# EAGLE design Duress_Badge_V2.0 (EAGLE 9.6.2)
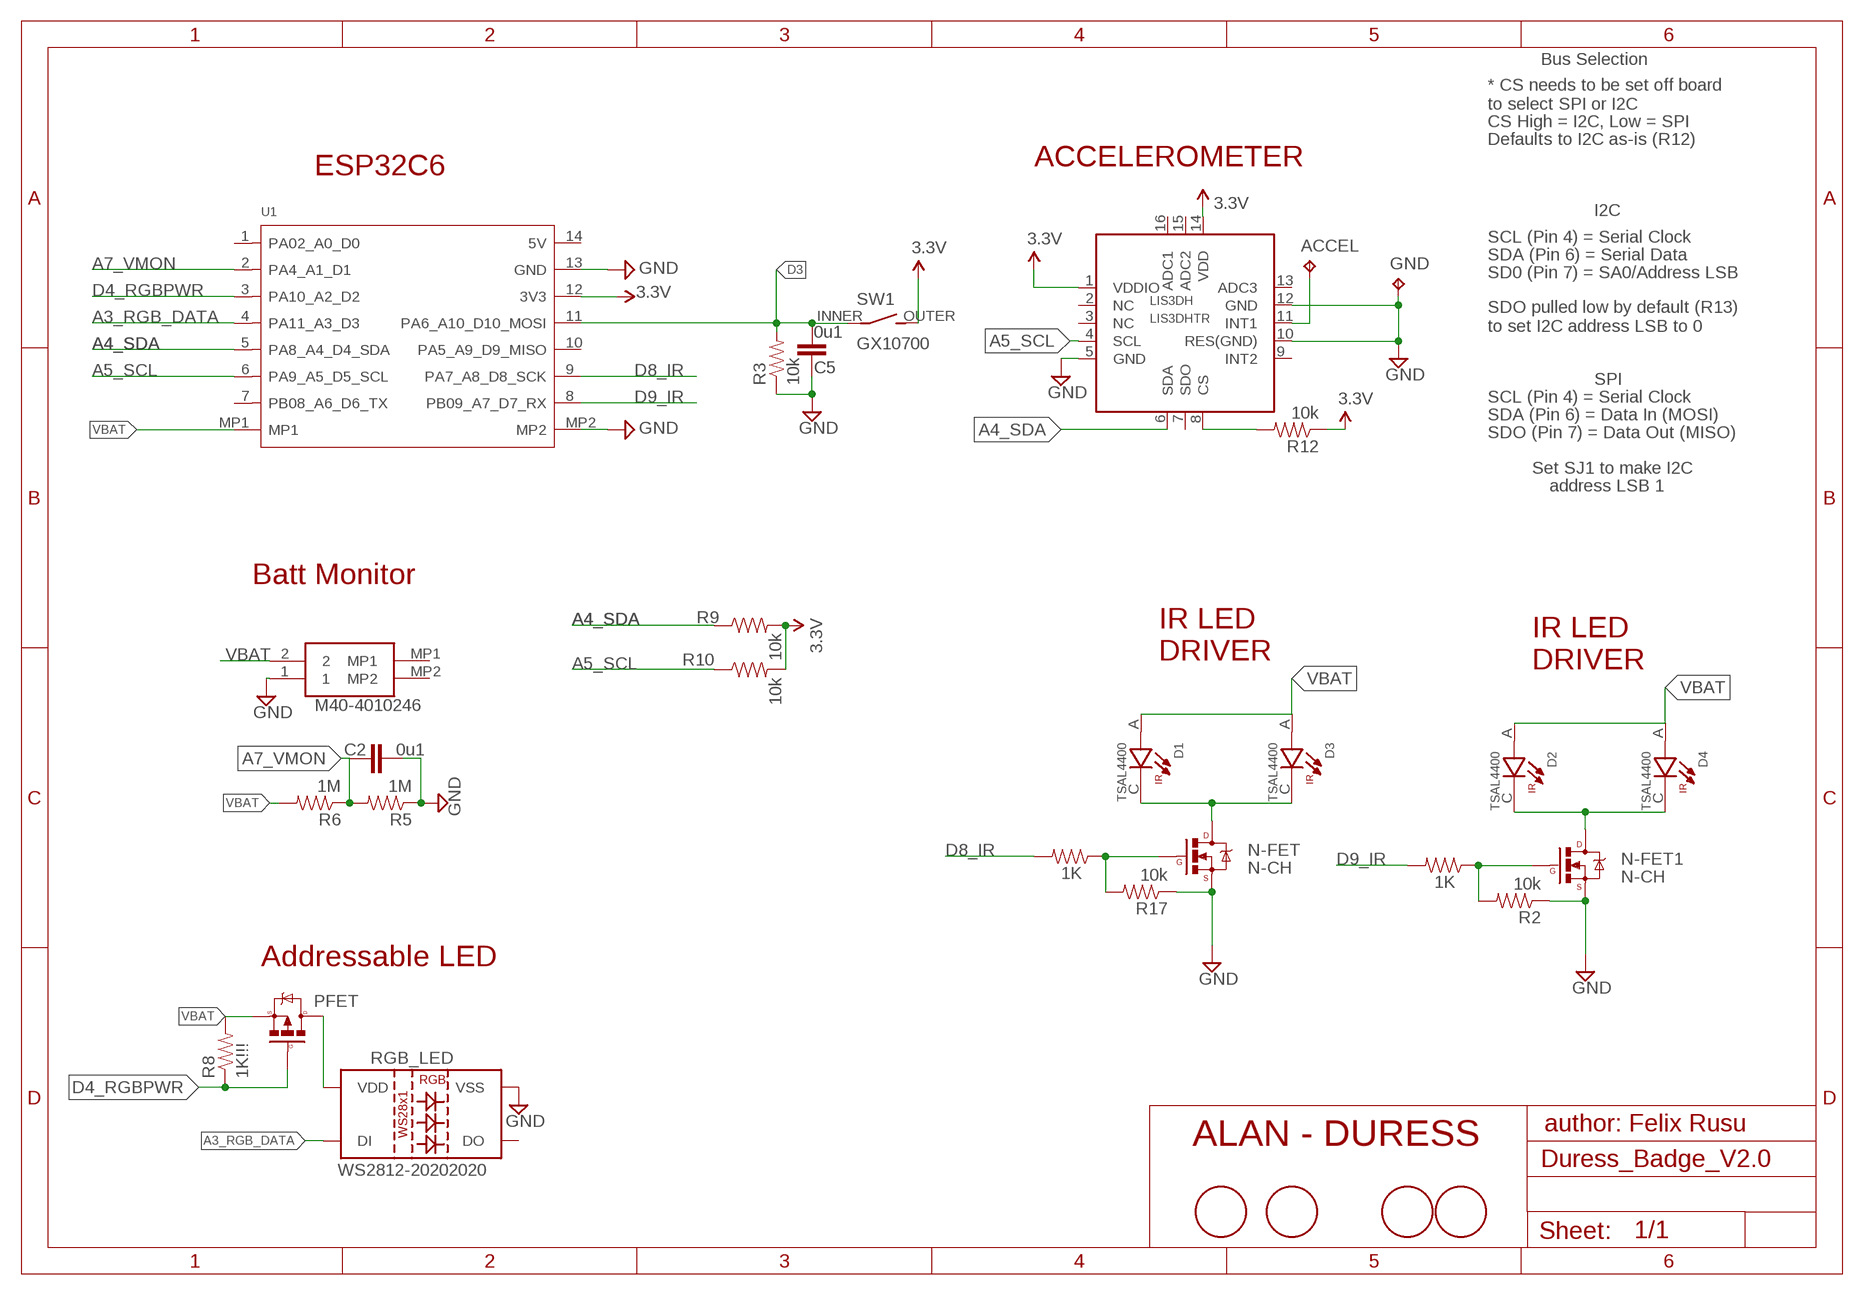
[diagram p0: schematic, sheet 1]

## Parts
ACCEL  TPB2,54  [B2,54]
BR_FIDUCIAL  FIDUCIAL1.5MM  [FIDUCIAL_1.5MM]
C2  0u1  CAP0603-CAP  [0603-CAP]
C5  0u1  CAP0603-CAP  [0603-CAP]
D1  TSAL4400  [LEDRD254W45D335H610]
D2  TSAL4400  [LEDRD254W45D335H610]
D3  TSAL4400  [LEDRD254W45D335H610]
D4  TSAL4400  [LEDRD254W45D335H610]
FIDUCIAL_BOTTOMRIGHT  FIDUCIALSQ  [FIDUCIAL_1.5MM_SQ]
FIDUCIAL_TOPLEFT  FIDUCIALSQ  [FIDUCIAL_1.5MM_SQ]
GND  TPB2,54  [B2,54]
JST1  M40-4010246  [M404010246]
LIS3DH  LIS3DHTR  ACCEL_LIS3DHTR  [LGA16_3X3MM]
N-FET  N-CH  MOSFET-NCHANNEL  [SOT23-3]
N-FET1  N-CH  MOSFET-NCHANNEL  [SOT23-3]
PFET  MOSFET-PCHANNELSMD  [SOT23-3]
R1  1K  RESISTOR0603-RES  [0603-RES]
R2  10k  RESISTOR0603-RES  [0603-RES]
R3  10k  RESISTOR0603-RES  [0603-RES]
R4  1K  RESISTOR0603-RES  [0603-RES]
R5  1M  RESISTOR0603-RES  [0603-RES]
R6  1M  RESISTOR0603-RES  [0603-RES]
R8  1K!!!  RESISTOR0603-RES  [0603-RES]
R9  10k  RESISTOR0603-RES  [0603-RES]
R10  10k  RESISTOR0603-RES  [0603-RES]
R12  10k  RESISTOR0603-RES  [0603-RES]
R17  10k  RESISTOR0603-RES  [0603-RES]
RGB_LED  WS2812-20202020  [WS2812-2020]
SW1  GX10700  [GX10700]
TL_FIDUCIAL  FIDUCIAL1.5MM  [FIDUCIAL_1.5MM]
U1  MOUDLE-SEEEDUINO-XIAO  [MOUDLE14P-2.54-21X17.8MM]

## Nets
A3_RGB_DATA: RGB_LED.3(DI) U1.4(PA11_A3_D3)
A4_SDA: LIS3DH.6(SDA) R9.1 U1.5(PA8_A4_D4_SDA)
A5_SCL: LIS3DH.4(SCL) R10.1 U1.6(PA9_A5_D5_SCL)
A7_VMON: C2.1 R5.2 R6.1 U1.2(PA4_A1_D1)
D3: C5.2 R3.2 SW1.INNER(P) U1.11(PA6_A10_D10_MOSI)
D4_RGBPWR: PFET.1(G) R8.1 U1.3(PA10_A2_D2)
D7_ACCEL: ACCEL.TP LIS3DH.11(INT1)
D8_IR: R4.2 U1.9(PA7_A8_D8_SCK)
D9_IR: R1.2 U1.8(PB09_A7_D7_RX)
GND: C2.2 C5.1 GND.TP JST1.1 LIS3DH.5(GND) LIS3DH.10(RES(GND)) LIS3DH.12(GND) N-FET1.2(S) N-FET.2(S) R2.1 R3.1 R5.1 R17.1 RGB_LED.2(VSS) U1.13(GND) U1.MP2
N$2: D1.C D3.C N-FET.3(D)
N$3: N-FET1.1(G) R1.1 R2.2
N$4: D2.C D4.C N-FET1.3(D)
N$5: PFET.3(D) RGB_LED.4(VDD)
N$6: N-FET.1(G) R4.1 R17.2
N$11: LIS3DH.8(CS) R12.2
VBAT: D1.A D2.A D3.A D4.A JST1.2 PFET.2(S) R6.2 R8.2 U1.MP1
VCC: LIS3DH.1(VDDIO) LIS3DH.14(VDD) R9.2 R10.2 R12.1 SW1.OUTER(S) U1.12(3V3) ; supply symbol labelled 3.3V
Unconnected: BR_FIDUCIAL.P$1(FIDUCIAL) FIDUCIAL_BOTTOMRIGHT.P$1(FIDUCIAL) FIDUCIAL_TOPLEFT.P$1(FIDUCIAL) JST1.MP1 JST1.MP2 LIS3DH.2(NC) LIS3DH.3(NC) LIS3DH.7(SDO) LIS3DH.9(INT2) LIS3DH.13(ADC3) LIS3DH.15(ADC2) LIS3DH.16(ADC1) RGB_LED.1(DO) TL_FIDUCIAL.P$1(FIDUCIAL) U1.1(PA02_A0_D0) U1.7(PB08_A6_D6_TX) U1.10(PA5_A9_D9_MISO) U1.14(5V)

## Notes on the sheet
- Bus Selection
- * CS needs to be set off board
  to select SPI or I2C
- CS High = I2C, Low = SPI
- ACCELEROMETER | Defaults to I2C as-is (R12)
- ESP32C6
- I2C
- SCL (Pin 4) = Serial Clock
- SDA (Pin 6) = Serial Data
- SD0 (Pin 7) = SA0/Address LSB
- SDO pulled low by default (R13)
  to set I2C address LSB to 0
- SPI
- SCL (Pin 4) = Serial Clock
- SDA (Pin 6) = Data In (MOSI)
- SDO (Pin 7) = Data Out (MISO)
- Set SJ1 to make I2C
- address LSB 1
- Batt Monitor
- IR LED
  DRIVER
- IR LED
  DRIVER
- Addressable LED
- author: Felix Rusu
- ALAN - DURESS

## Library data of the parts
ACCEL GND = testpad:TP: Test pad
BR_FIDUCIAL FIDUCIAL_BOTTOMRIGHT FIDUCIAL_TOPLEFT TL_FIDUCIAL = LowPowerLab:FIDUCIAL
C2 C5 = LowPowerLab:CAP: Capacitor Standard 0603 ceramic capacitor, and 0.1" leaded capacitor.
D1-D4 = TSAL4400:TSAL4400: Check availability <https://pricing.snapeda.com/parts/TSAL4400/Vishay%20Semiconductor/view-part?ref=eda>; AVAILABILITY: In Stock; CHECK_PRICES: https://www.snapeda.com/parts/TSAL4400/Vishay/view-part/?ref=eda; DESCRIPTION: Infrared (IR) Emitter 940nm 1.35V 100mA 16mW/sr @ 100mA 50° Radial, 3mm Dia (T-1); MF: Vishay Semiconductor; MP: TSAL4400; PACKAGE: Package; PRICE: None; SNAPEDA_LINK: https://www.snapeda.com/parts/TSAL4400/Vishay/view-part/?ref=snap
JST1 = M40-4010246:M40-4010246: Headers & Wire Housings 2P SIL SMT HORIZ SHROUDED TAB HEADER Source: Datasheet <https://componentsearchengine.com/Datasheets/2/M40-4010246.pdf>; DESCRIPTION: Headers & Wire Housings 2P SIL SMT HORIZ SHROUDED TAB HEADER; HEIGHT: 3.15mm; MANUFACTURER_NAME: Harwin; MANUFACTURER_PART_NUMBER: M40-4010246; MOUSER_PART_NUMBER: 855-M40-4010246; MOUSER_PRICE-STOCK: https://www.mouser.co.uk/ProductDetail/Harwin/M40-4010246?qs=%252Bk6%2F5FB6qrkoTdPFThSz5A%3D%3D
LIS3DH = microbuilder:ACCEL_LIS3DHTR: LIS3DHTR 3-Axis Accelerometer with I2C/SPI Interface VDD: 1.71-3.6V VDDIO: 1.71-VDD+0.1V Scale: +/-2g, 4g, 8g, 16g with 16--bit data output Temp:: -40°C - 85°C Mouser: 511-LIS3DHTR Digikey: 497-10613-1-ND
N-FET N-FET1 = LowPowerLab:MOSFET-NCHANNEL: Generic PMOSFET
PFET = LowPowerLab:MOSFET-PCHANNEL: Generic PMOSFET
R1-R6 R8-R10 R12 R17 = LowPowerLab:RESISTOR: Resistor Basic schematic elements and footprints for 0603, 1206, and PTH resistors.
RGB_LED = LowPowerLab:WS2812-2020
SW1 = snaptron_Alan:GX10700
U1 = Seeeduino-XIAO-footprint-eagle:MOUDLE-SEEEDUINO-XIAO

## Net classes
1 power: width 0.381 mm, clearance 0.254 mm

## Board
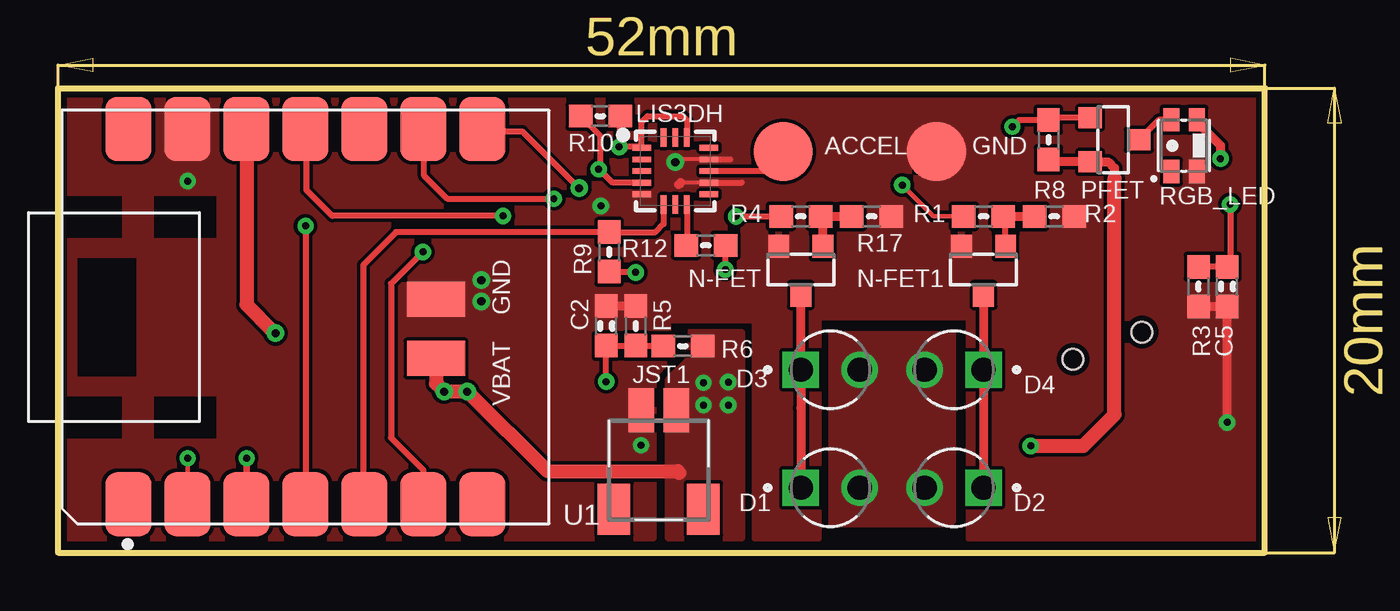
[diagram p1: board, top side]
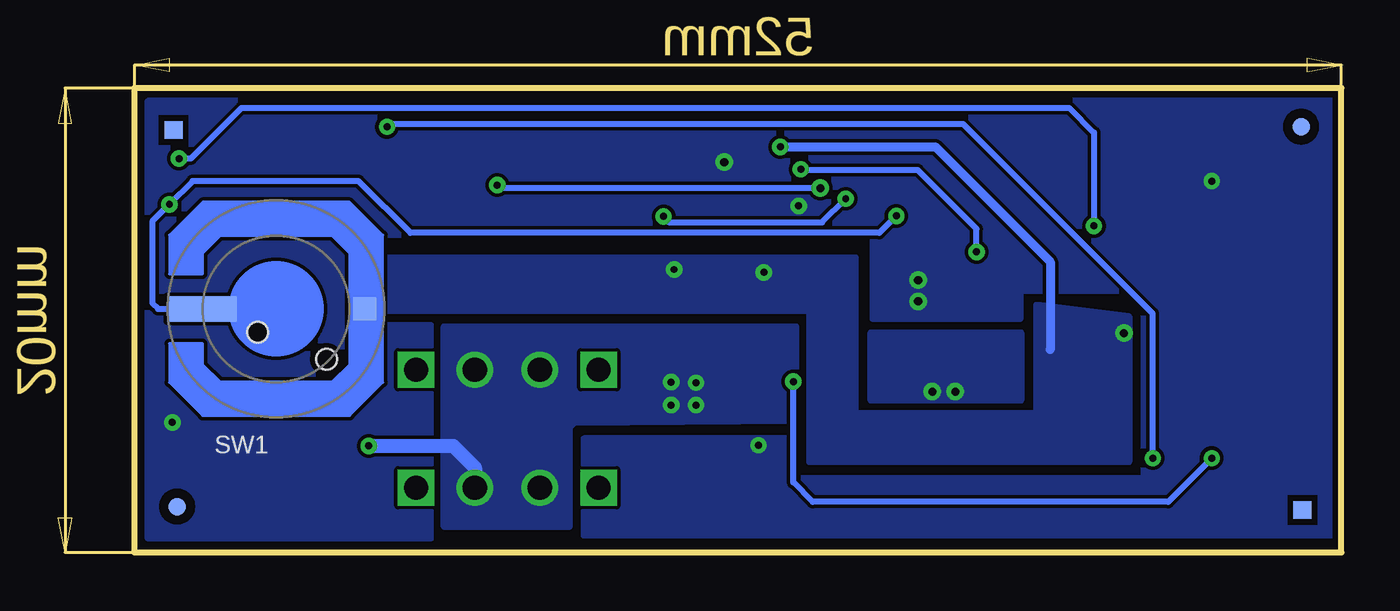
[diagram p2: board, bottom side, seen from below]

Size 52 x 20 mm. Coordinates in mm from the lower left corner, seen from the top.
Outline: 0,0 0,20 52,20 52,0 0,0
Copper layers (1*16): Top 0.035mm / dielectric 1.5mm / Bottom 0.035mm
Design rules "default *": minimum track width 7mil, minimum drill 0.3mm, track to track 6mil, track to pad 7mil, pad to pad 7mil, via to via 7mil, smd to smd 7mil, copper to edge 10mil, drill to drill 6mil, minimum pad ring 10mil, minimum via ring 8mil, stop-mask expansion 4mil, vias tented up to drill 0.5mm, thermal gap 0mil

### Footprints (pad centres in the part's own frame; a part is rotated, then mirrored left to right if it is on the bottom)
B2,54 = smd 2.54 x 2.54: TP 0,0
FIDUCIAL_1.5MM = smd 0.762 x 0.762: P$1 0,0
0603-CAP = smd 1.016 x 0.965: 1 -0.85,0; 2 0.85,0
LEDRD254W45D335H610 = drill 1.04 pad 1.56: A 1.27,0 | drill 1.04 pad 1.56 square: C -1.27,0
FIDUCIAL_1.5MM_SQ = smd 0.762 x 0.762: P$1 0,0
M404010246 = smd 1.1 x 1.9: 1 -0.754,2.415; 2 0.754,2.415 | smd 1.4 x 2.2: MP1 1.927,-1.841; MP2 -1.927,-1.841
LGA16_3X3MM = smd 0.8 x 0.25: 1 -1.45,1; 2 -1.45,0.5; 3 -1.45,0; 4 -1.45,-0.5; 5 -1.45,-1; 9 1.45,-1; 10 1.45,-0.5; 11 1.45,0; 12 1.45,0.5; 13 1.45,1 | smd 0.25 x 0.8: 6 -0.5,-1.45; 7 0,-1.45; 8 0.5,-1.45; 14 0.5,1.45; 15 0,1.45; 16 -0.5,1.45
SOT23-3 = smd 0.9 x 1: 1 -0.95,-1; 2 0.95,-1; 3 0,1.1
0603-RES = smd 1.016 x 0.965: 1 -0.85,0; 2 0.85,0
WS2812-2020 = smd 1 x 0.7: 1 1.115,-0.55; 2 1.115,0.55; 3 -1.115,0.55; 4 -1.115,-0.55
GX10700 = smd 3 x 1.1: INNER 3.2,0 | smd 1 x 1: OUTER -3.815,0 | hole 0.89: 0.8,1; -2.173,2.173
MOUDLE14P-2.54-21X17.8MM = smd 2.75 x 2: 1 0.835,18.12; 2 0.835,15.58; 3 0.835,13.04; 4 0.835,10.5; 5 0.835,7.96; 6 0.835,5.42; 7 0.835,2.88; 8 17,2.88; 9 17,5.42; 10 17,7.96; 11 17,10.5; 12 17,13.04; 13 17,15.58; 14 17,18.12 | smd 1.5 x 2.5: MP1 7.12,4.87; MP2 9.66,4.87

### Placement (x,y rotation side)
ACCEL  31.24,17.27 0 top
BR_FIDUCIAL  1.74,18.35 180 bottom
C2  23.62,9.77 90 top
C5  50.37,11.45 90 top
D1  33.27,2.79 0 top
D2  38.61,2.79 180 top
D3  33.27,7.87 0 top
D4  38.61,7.87 180 top
FIDUCIAL_BOTTOMRIGHT  50.32,18.2 0 bottom
FIDUCIAL_TOPLEFT  1.69,1.83 0 bottom
GND  37.85,17.27 0 top
JST1  25.88,3.71 0 top
LIS3DH  26.59,16.43 0 top
N-FET  32,12.19 180 top
N-FET1  39.88,12.19 180 top
PFET  45.47,17.78 270 top
R1  39.88,14.48 180 top
R2  42.93,14.48 180 top
R3  49.14,11.45 90 top
R4  32,14.48 180 top
R5  24.89,9.77 270 top
R6  26.92,8.89 0 top
R8  42.67,17.78 270 top
R9  23.75,12.95 270 top
R10  23.37,18.8 0 top
R12  27.91,13.23 180 top
R17  35.05,14.48 180 top
RGB_LED  48.51,17.53 270 top
SW1  45.9,10.5 180 bottom
TL_FIDUCIAL  50.17,1.98 180 bottom
U1  21.16,1.24 90 top

### Tracks (layer width: path | path; a pad name or v marks a point on that pad's centre or on a via)
A3_RGB_DATA  (via drill 0.3)
  Top 0.254: U1.4 10.66,2.04 10.67,2.03 v10.67,14.07
  Top 0.381: RGB_LED.3 49.06,18.57 50.09,17.54 v50.09,16.97
  Bottom 0.254: v10.67,14.07 10.67,18.09 11.73,19.15 47.4,19.15 49.58,16.97 v50.09,16.97
A4_SDA
  Top 0.203: 13.16,3.4 13.16,1.92 13.24,1.92
  Top 0.254: 13.16,3.4 13.16,12.39 14.57,13.8 R9.1 25.74,13.8 26.09,14.16 LIS3DH.6
  Top 0.61: U1.5 13.2,1.96 13.24,1.92
A5_SCL  (via drill 0.3)
  Top 0.203: 15.87,3.26 15.87,2.21 U1.6
  Top 0.254: v15.72,12.95 14.35,11.58 14.35,4.95 15.74,3.57 U1.6 | LIS3DH.4 23.89,15.93 23.42,16.41 23.42,16.51 v23.29,16.51 23.37,16.59 23.37,17.95 R10.1
  Bottom 0.254: v15.72,12.95 15.72,13.95 18.26,16.48 23.27,16.48 v23.29,16.51
A7_VMON  (via drill 0.3)
  Top 0.203: R5.2 26.05,8.91 | v5.59,4.06 U1.2
  Top 0.254: v23.62,7.37 C2.1 26.05,8.91 R6.1 | v5.59,4.06 5.66,3.99
  Bottom 0.254: v23.62,7.37 23.62,3.02 22.78,2.18 7.47,2.18 v5.59,4.06
D3  (via drill 0.3)
  Top 0.254: v19.18,14.5 11.81,14.5 10.7,15.61 10.7,15.7 10.7,18.09 10.7,18.2 U1.11 | v50.5,15 50.5,12.43 C5.2 R3.2
  Bottom 0.254: SW1.INNER 50.99,10.5 51.24,10.74 51.24,14.26 v50.5,15 49.5,16 42.35,16 40.12,13.77 19.91,13.77 v19.18,14.5
D4_RGBPWR  (via drill 0.3)
  Top 0.203: 8.13,3.48 8.2,3.41
  Top 0.254: 8.13,1.97 8.13,3.48 v8.13,4.06 8.12,4.05 U1.3 | PFET.1 42.67,18.73 | R8.1 41.41,18.63 v41.12,18.34
  Top 0.381: 42.67,18.73 R8.1
  Bottom 0.254: v8.13,4.06 8.13,10.29 16.31,18.47 41,18.47 v41.12,18.34
D7_ACCEL
  Top 0.254: LIS3DH.11 30.4,16.43 ACCEL.TP
D8_IR  (via drill 0.3)
  Top 0.254: v21.36,15.24 16.76,15.24 15.78,16.22 15.78,18.09 15.78,18.2 U1.9 | v29.21,14.48 R4.2
  Bottom 0.254: v21.36,15.24 22.38,14.22 28.96,14.22 v29.21,14.48
D9_IR  (via drill 0.3, 0.35)
  Top 0.203: v36.37,15.82 37.72,14.48 R1.2
  Top 0.254: v22.45,15.69 v22.45,15.7 | v22.45,15.7 20.02,18.13 19.25,18.13 | 19.25,18.13 18.49,18.13 | v22.45,15.7 | U1.8 19.14,18.25 19.25,18.13
  Bottom 0.254: v22.45,15.7 36.25,15.7 v36.37,15.82
GND  (via drill 0.3, 0.35)
  Top 0.178: LIS3DH.12 26.71,16.93 | LIS3DH.10 26.83,15.93
  Top 0.254: LIS3DH.12 28.97,16.93 | LIS3DH.10 29.46,15.93
  Top 0.381: R5.1 C2.2 23.32,10.62 | R3.1 C5.1 v50.37,5.61 | 26.71,16.93 v26.59,16.82 | 26.83,15.93 26.75,15.85
  other vias: 5.59,16 25.12,4.62 23.39,14.94 18.24,10.82 18.24,11.73
  pour Bottom: 0.38,19.43 51.44,19.43 51.44,0.64 39.24,0.64 39.24,9.78 41.02,9.78 41.15,9.65 41.15,13.72 20.19,13.72 20.19,10.08 13.84,10.08 13.84,11.3 8.64,11.3 8.51,11.18 8.51,3.17 23.62,3.17 23.62,4.9 32.64,4.9 32.64,0.76 0.51,0.76 0.38,0.64
  pour Top: 0.38,19.43 0.38,0.64 25.65,0.64 25.65,7.62 26.29,8.26 26.29,10.03 30.02,10.03 30.02,0.64 32.77,0.64 32.77,10.16 39.24,10.16 39.24,0.64 51.56,0.64 51.56,19.3 51.69,19.43
N$2
  Top 0.203: N-FET.3 32,7.75
  Top 0.381: 32,7.75 32,6.22 D1.C | D3.C N-FET.3
N$3
  Top 0.254: N-FET1.1 40.83,14.38
  Top 0.381: 40.83,14.38 R1.1 R2.2
N$4
  Top 0.203: D4.C N-FET1.3
  Top 0.381: N-FET1.3 D2.C
N$5
  Top 0.254: RGB_LED.4 47.43,18.64 PFET.3
N$6
  Top 0.381: N-FET.1 32.95,14.38 R4.1 R17.2
N$11
  Top 0.254: LIS3DH.8 27.09,13.26 R12.2
VBAT  (via drill 0.3, 0.35)
  Top 0.305: v17.63,6.93 17.65,6.93
  Top 0.381: R8.2 42.77,16.83 PFET.2 45.25,16.83 45.52,16.56 45.52,16.1
  Top 0.61: v41.91,4.6 44.17,4.6 45.52,5.94 45.52,16.1 | 17.65,6.93 21.08,3.5 26.7,3.5 26.77,3.43 | v17.63,6.93 v16.64,6.93 16.28,7.29 U1.MP1
  Bottom 0.61: v41.91,4.6 38.28,4.6 37.34,3.66 D2.A
  other vias: 27.81,6.35 28.88,6.35 27.81,7.32 28.88,7.34
  pour Top: 38.58,9.4 33.3,9.4 33.3,1.22 38.43,1.22 38.58,1.37
  pour Top: 27.18,9.47 27.18,8.33 26.29,7.44 26.29,0.64 29.46,0.64 29.46,9.47
  pour Bottom: 23.52,9.73 23.52,5.67 33.07,5.59 33.27,5.38 33.27,1.12 38.66,1.12 38.66,9.73
  pour Bottom: 13.82,9.47 13.82,6.55 20.27,6.55 20.27,9.47
VCC  (via drill 0.3, 0.35)
  Top 0.254: LIS3DH.14 27.1,17.89 27.1,18.62 26.92,18.8 25.4,18.8 25.14,18.54 LIS3DH.1 25.1,17.48 v24.18,17.48 24.22,17.51 R10.2 | R9.2 24.6,12.1 24.64,12.06 v24.89,12.06 | R12.1 v28.75,12.19 28.75,12.34
  Top 0.61: U1.12 8.12,10.68 9.32,9.47 9.35,9.47 v9.37,9.45
  Bottom 0.381: v24.18,17.48 17.5,17.48 12.55,12.52 12.55,8.74
  pour Bottom: 9.17,3.91 22.91,3.91 22.91,10.41 42.11,10.41 42.11,12.7 20.95,12.7 20.95,5.99 13.13,5.99 13.13,10.67 9.17,10.18

### Text on the board
tNames: RGB_LED | GND | D4 | VBAT
bNames: SW1